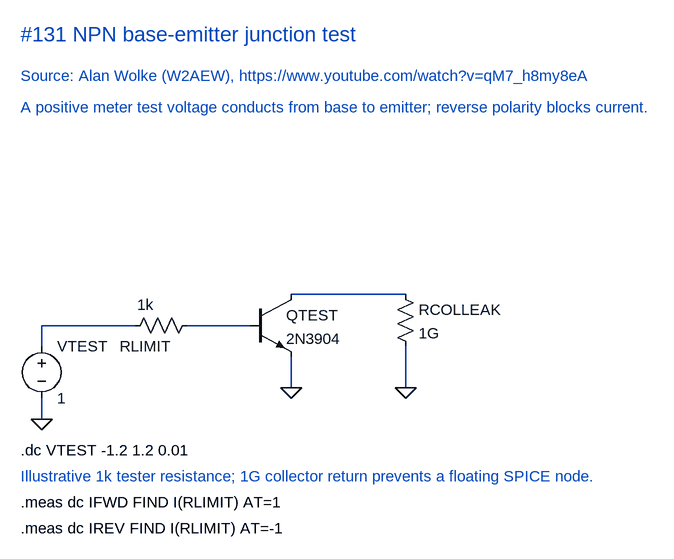
[diagram p0: schematic NPN junction test.asc]
NPN junction test.asc, the LTspice schematic file:
Version 4
SHEET 1 960 880
WIRE 240 480 96 480
WIRE 96 512 96 480
WIRE 416 480 320 480
WIRE 656 432 480 432
WIRE 480 576 480 528
WIRE 656 576 656 512
WIRE 96 624 96 592
FLAG 96 624 0
FLAG 480 576 0
FLAG 656 576 0
SYMBOL voltage 96 496 R0
SYMATTR InstName VTEST
SYMATTR Value 1
SYMBOL res 224 496 R270
WINDOW 0 0 32 VBottom 2
WINDOW 3 32 32 VTop 2
SYMATTR InstName RLIMIT
SYMATTR Value 1k
SYMBOL npn 416 432 R0
SYMATTR InstName QTEST
SYMATTR Value 2N3904
SYMBOL res 640 416 R0
SYMATTR InstName RCOLLEAK
SYMATTR Value 1G
TEXT 64 32 Left 3 ;#131 NPN base-emitter junction test
TEXT 64 96 Left 2 ;Source: Alan Wolke (W2AEW), https://www.youtube.com/watch?v=qM7_h8my8eA
TEXT 64 144 Left 2 ;A positive meter test voltage conducts from base to emitter; reverse polarity blocks current.
TEXT 64 672 Left 2 !.dc VTEST -1.2 1.2 0.01
TEXT 64 752 Left 2 !.meas dc IFWD FIND I(RLIMIT) AT=1
TEXT 64 792 Left 2 !.meas dc IREV FIND I(RLIMIT) AT=-1
TEXT 64 712 Left 2 ;Illustrative 1k tester resistance; 1G collector return prevents a floating SPICE node.

The netlist it stands for:
* NPN junction test.asc
VTEST N001 0 1
RLIMIT N001 N002 1k
QTEST N003 N002 0 0 2N3904
RCOLLEAK N003 0 1G
.model NPN NPN
.model PNP PNP
.lib standard.bjt
* #131 NPN base-emitter junction test
* Source: Alan Wolke (W2AEW), https://www.youtube.com/watch?v=qM7_h8my8eA
* A positive meter test voltage conducts from base to emitter; reverse polarity blocks current.
.dc VTEST -1.2 1.2 0.01
.meas dc IFWD FIND I(RLIMIT) AT=1
.meas dc IREV FIND I(RLIMIT) AT=-1
* Illustrative 1k tester resistance; 1G collector return prevents a floating SPICE node.
.backanno
.end